# Altium schematic sheet ABPG_TOP.SchDoc
size A3; SheetNumber: 1; SheetTotal: 1; SchematicName: Top Schematic
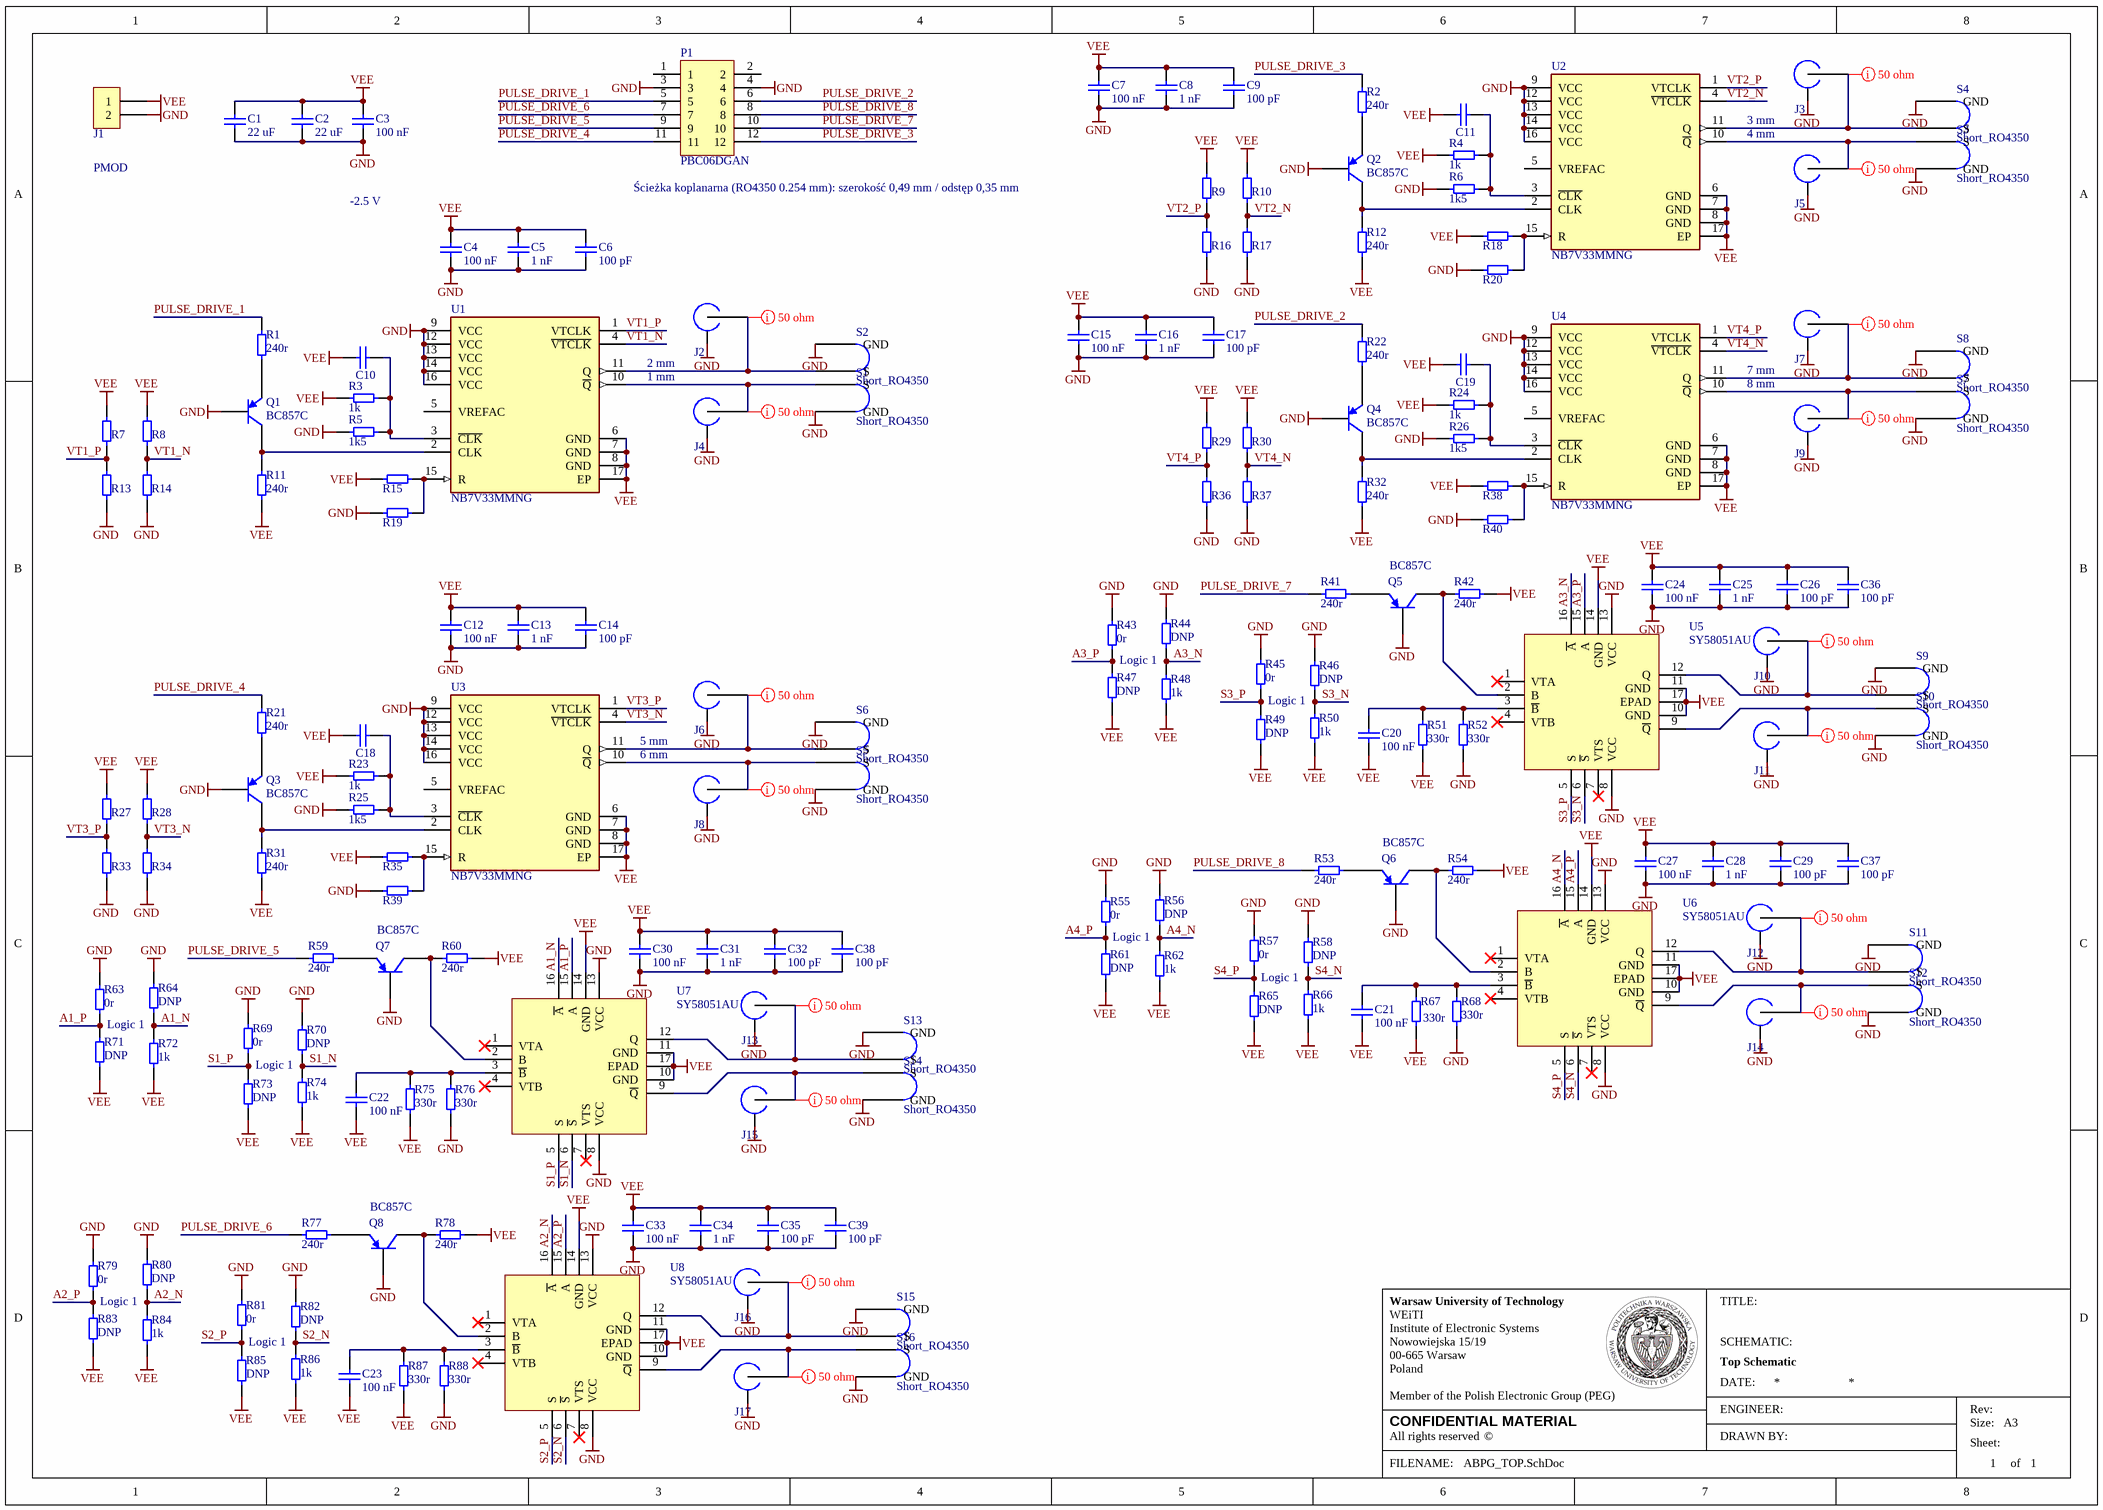
[diagram p0: ABPG_TOP.SchDoc]

## Parts
C1  22 uF  [C1210]
C2  22 uF  [C1210]
C3  100 nF  [C0402]
C4  100 nF  [C0402]
C5  1 nF  [C0402]
C6  100 pF  [C0402]
C7  100 nF  [C0402]
C8  1 nF  [C0402]
C9  100 pF  [C0402]
C10  100 nF  [0603-Capacitor]  (value not drawn)
C11  100 nF  [0603-Capacitor]  (value not drawn)
C12  100 nF  [C0402]
C13  1 nF  [C0402]
C14  100 pF  [C0402]
C15  100 nF  [C0402]
C16  1 nF  [C0402]
C17  100 pF  [C0402]
C18  100 nF  [0603-Capacitor]  (value not drawn)
C19  100 nF  [0603-Capacitor]  (value not drawn)
C20  100 nF  [0603-Capacitor]
C21  100 nF  [0603-Capacitor]
C22  100 nF  [0603-Capacitor]
C23  100 nF  [0603-Capacitor]
C24  100 nF  [C0402]
C25  1 nF  [C0402]
C26  100 pF  [C0402]
C27  100 nF  [C0402]
C28  1 nF  [C0402]
C29  100 pF  [C0402]
C30  100 nF  [C0402]
C31  1 nF  [C0402]
C32  100 pF  [C0402]
C33  100 nF  [C0402]
C34  1 nF  [C0402]
C35  100 pF  [C0402]
C36  100 pF  [C0402]
C37  100 pF  [C0402]
C38  100 pF  [C0402]
C39  100 pF  [C0402]
J1  1803426  [1803426]  (value not drawn)
J2  SF1621-60026  [SF1621-60026-RO4350-0.254]  (value not drawn)
J3  SF1621-60026  [SF1621-60026-RO4350-0.254]  (value not drawn)
J4  SF1621-60026  [SF1621-60026-RO4350-0.254]  (value not drawn)
J5  SF1621-60026  [SF1621-60026-RO4350-0.254]  (value not drawn)
J6  SF1621-60026  [SF1621-60026-RO4350-0.254]  (value not drawn)
J7  SF1621-60026  [SF1621-60026-RO4350-0.254]  (value not drawn)
J8  SF1621-60026  [SF1621-60026-RO4350-0.254]  (value not drawn)
J9  SF1621-60026  [SF1621-60026-RO4350-0.254]  (value not drawn)
J10  SF1621-60026  [SF1621-60026-RO4350-0.254]  (value not drawn)
J11  SF1621-60026  [SF1621-60026-RO4350-0.254]  (value not drawn)
J12  SF1621-60026  [SF1621-60026-RO4350-0.254]  (value not drawn)
J13  SF1621-60026  [SF1621-60026-RO4350-0.254]  (value not drawn)
J14  SF1621-60026  [SF1621-60026-RO4350-0.254]  (value not drawn)
J15  SF1621-60026  [SF1621-60026-RO4350-0.254]  (value not drawn)
J16  SF1621-60026  [SF1621-60026-RO4350-0.254]  (value not drawn)
J17  SF1621-60026  [SF1621-60026-RO4350-0.254]  (value not drawn)
P1  PBC06DGAN  [PBC06DGAN]
Q1  BC857C  [INF-SOT23_N]
Q2  BC857C  [INF-SOT23_N]
Q3  BC857C  [INF-SOT23_N]
Q4  BC857C  [INF-SOT23_N]
Q5  BC857C  [INF-SOT23_N]
Q6  BC857C  [INF-SOT23_N]
Q7  BC857C  [INF-SOT23_N]
Q8  BC857C  [INF-SOT23_N]
R1  240r  [0603-Resistor]
R2  240r  [0603-Resistor]
R3  1k  [0603-Resistor]
R4  1k  [0603-Resistor]
R5  1k5  [0603-Resistor]
R6  1k5  [0603-Resistor]
R7  DNP  [0603-Resistor]  (value not drawn)
R8  DNP  [0603-Resistor]  (value not drawn)
R9  DNP  [0603-Resistor]  (value not drawn)
R10  DNP  [0603-Resistor]  (value not drawn)
R11  240r  [0603-Resistor]
R12  240r  [0603-Resistor]
R13  DNP  [0603-Resistor]  (value not drawn)
R14  DNP  [0603-Resistor]  (value not drawn)
R15  *  [0603-Resistor]  (value not drawn)
R16  DNP  [0603-Resistor]  (value not drawn)
R17  DNP  [0603-Resistor]  (value not drawn)
R18  *  [0603-Resistor]  (value not drawn)
R19  *  [0603-Resistor]  (value not drawn)
R20  *  [0603-Resistor]  (value not drawn)
R21  240r  [0603-Resistor]
R22  240r  [0603-Resistor]
R23  1k  [0603-Resistor]
R24  1k  [0603-Resistor]
R25  1k5  [0603-Resistor]
R26  1k5  [0603-Resistor]
R27  DNP  [0603-Resistor]  (value not drawn)
R28  DNP  [0603-Resistor]  (value not drawn)
R29  DNP  [0603-Resistor]  (value not drawn)
R30  DNP  [0603-Resistor]  (value not drawn)
R31  240r  [0603-Resistor]
R32  240r  [0603-Resistor]
R33  DNP  [0603-Resistor]  (value not drawn)
R34  DNP  [0603-Resistor]  (value not drawn)
R35  *  [0603-Resistor]  (value not drawn)
R36  DNP  [0603-Resistor]  (value not drawn)
R37  DNP  [0603-Resistor]  (value not drawn)
R38  *  [0603-Resistor]  (value not drawn)
R39  *  [0603-Resistor]  (value not drawn)
R40  *  [0603-Resistor]  (value not drawn)
R41  240r  [0603-Resistor]
R42  240r  [0603-Resistor]
R43  0r  [0603-Resistor]
R44  DNP  [0603-Resistor]
R45  0r  [0603-Resistor]
R46  DNP  [0603-Resistor]
R47  DNP  [0603-Resistor]
R48  1k  [0603-Resistor]
R49  DNP  [0603-Resistor]
R50  1k  [0603-Resistor]
R51  330r  [0603-Resistor]
R52  330r  [0603-Resistor]
R53  240r  [0603-Resistor]
R54  240r  [0603-Resistor]
R55  0r  [0603-Resistor]
R56  DNP  [0603-Resistor]
R57  0r  [0603-Resistor]
R58  DNP  [0603-Resistor]
R59  240r  [0603-Resistor]
R60  240r  [0603-Resistor]
R61  DNP  [0603-Resistor]
R62  1k  [0603-Resistor]
R63  0r  [0603-Resistor]
R64  DNP  [0603-Resistor]
R65  DNP  [0603-Resistor]
R66  1k  [0603-Resistor]
R67  330r  [0603-Resistor]
R68  330r  [0603-Resistor]
R69  0r  [0603-Resistor]
R70  DNP  [0603-Resistor]
R71  DNP  [0603-Resistor]
R72  1k  [0603-Resistor]
R73  DNP  [0603-Resistor]
R74  1k  [0603-Resistor]
R75  330r  [0603-Resistor]
R76  330r  [0603-Resistor]
R77  240r  [0603-Resistor]
R78  240r  [0603-Resistor]
R79  0r  [0603-Resistor]
R80  DNP  [0603-Resistor]
R81  0r  [0603-Resistor]
R82  DNP  [0603-Resistor]
R83  DNP  [0603-Resistor]
R84  1k  [0603-Resistor]
R85  DNP  [0603-Resistor]
R86  1k  [0603-Resistor]
R87  330r  [0603-Resistor]
R88  330r  [0603-Resistor]
S1  Short_RO4350  [STD_SHORT]  (net tie, no BOM)
S2  Short_RO4350  [STD_SHORT]  (net tie, no BOM)
S3  Short_RO4350  [STD_SHORT]  (net tie, no BOM)
S4  Short_RO4350  [STD_SHORT]  (net tie, no BOM)
S5  Short_RO4350  [STD_SHORT]  (net tie, no BOM)
S6  Short_RO4350  [STD_SHORT]  (net tie, no BOM)
S7  Short_RO4350  [STD_SHORT]  (net tie, no BOM)
S8  Short_RO4350  [STD_SHORT]  (net tie, no BOM)
S9  Short_RO4350  [STD_SHORT]  (net tie, no BOM)
S10  Short_RO4350  [STD_SHORT]  (net tie, no BOM)
S11  Short_RO4350  [STD_SHORT]  (net tie, no BOM)
S12  Short_RO4350  [STD_SHORT]  (net tie, no BOM)
S13  Short_RO4350  [STD_SHORT]  (net tie, no BOM)
S14  Short_RO4350  [STD_SHORT]  (net tie, no BOM)
S15  Short_RO4350  [STD_SHORT]  (net tie, no BOM)
S16  Short_RO4350  [STD_SHORT]  (net tie, no BOM)
U1  NB7V33MMNG  [FP-485G-01-MFG]
U2  NB7V33MMNG  [FP-485G-01-MFG]
U3  NB7V33MMNG  [FP-485G-01-MFG]
U4  NB7V33MMNG  [FP-485G-01-MFG]
U5  SY58051AU  [QFN50P300X300X90_HS-17N]
U6  SY58051AU  [QFN50P300X300X90_HS-17N]
U7  SY58051AU  [QFN50P300X300X90_HS-17N]
U8  SY58051AU  [QFN50P300X300X90_HS-17N]

## Nets
GND: C1.2 C2.2 C3.2 C4.2 C5.2 C6.2 C7.2 C8.2 C9.2 C12.2 C13.2 C14.2 C15.2 C16.2 C17.2 C24.2 C25.2 C26.2 C27.2 C28.2 C29.2 C30.2 C31.2 C32.2 C33.2 C34.2 C35.2 C36.2 C37.2 C38.2 C39.2 J1.2 J2.0(GND) J3.0(GND) J4.0(GND) J5.0(GND) J6.0(GND) J7.0(GND) J8.0(GND) J9.0(GND) J10.0(GND) J11.0(GND) J12.0(GND) J13.0(GND) J14.0(GND) J15.0(GND) J16.0(GND) J17.0(GND) P1.3 P1.4 Q1.1(B) Q2.1(B) Q3.1(B) Q4.1(B) Q5.1(B) Q6.1(B) Q7.1(B) Q8.1(B) R5.2 R6.2 R13.2 R14.2 R16.2 R17.2 R19.2 R20.2 R25.2 R26.2 R33.2 R34.2 R36.2 R37.2 R39.2 R40.2 R43.2 R44.1 R45.1 R46.2 R52.2 R55.2 R56.1 R57.1 R58.2 R63.2 R64.1 R68.2 R69.1 R70.2 R76.2 R79.2 R80.1 R81.1 R82.2 R88.2 S1.0(GND) S2.0(GND) S3.0(GND) S4.0(GND) S5.0(GND) S6.0(GND) S7.0(GND) S8.0(GND) S9.0(GND) S10.0(GND) S11.0(GND) S12.0(GND) S13.0(GND) S14.0(GND) S15.0(GND) S16.0(GND) U1.9(VCC) U1.12(VCC) U1.13(VCC) U1.14(VCC) U1.16(VCC) U2.9(VCC) U2.12(VCC) U2.13(VCC) U2.14(VCC) U2.16(VCC) U3.9(VCC) U3.12(VCC) U3.13(VCC) U3.14(VCC) U3.16(VCC) U4.9(VCC) U4.12(VCC) U4.13(VCC) U4.14(VCC) U4.16(VCC) U5.8(VCC) U5.13(VCC) U6.8(VCC) U6.13(VCC) U7.8(VCC) U7.13(VCC) U8.8(VCC) U8.13(VCC)
VEE: C1.1 C2.1 C3.1 C4.1 C5.1 C6.1 C7.1 C8.1 C9.1 C10.1 C11.1 C12.1 C13.1 C14.1 C15.1 C16.1 C17.1 C18.1 C19.1 C20.2 C21.2 C22.2 C23.2 C24.1 C25.1 C26.1 C27.1 C28.1 C29.1 C30.1 C31.1 C32.1 C33.1 C34.1 C35.1 C36.1 C37.1 C38.1 C39.1 J1.1 R3.2 R4.2 R7.1 R8.1 R9.1 R10.1 R11.2 R12.2 R15.2 R18.2 R23.2 R24.2 R27.1 R28.1 R29.1 R30.1 R31.2 R32.2 R35.2 R38.2 R42.2 R47.2 R48.1 R49.1 R50.2 R51.2 R54.2 R60.2 R61.2 R62.1 R65.1 R66.2 R67.2 R71.2 R72.1 R73.1 R74.2 R75.2 R78.2 R83.2 R84.1 R85.1 R86.2 R87.2 U1.6(GND) U1.7(GND) U1.8(GND) U1.17(EP) U2.6(GND) U2.7(GND) U2.8(GND) U2.17(EP) U3.6(GND) U3.7(GND) U3.8(GND) U3.17(EP) U4.6(GND) U4.7(GND) U4.8(GND) U4.17(EP) U5.10(GND) U5.11(GND) U5.14(GND) U5.17(EPAD) U6.10(GND) U6.11(GND) U6.14(GND) U6.17(EPAD) U7.10(GND) U7.11(GND) U7.14(GND) U7.17(EPAD) U8.10(GND) U8.11(GND) U8.14(GND) U8.17(EPAD)
A1_N: R64.2 R72.2 U7.16(~{A})
A1_P: R63.1 R71.1 U7.15(A)
A2_N: R80.2 R84.2 U8.16(~{A})
A2_P: R79.1 R83.1 U8.15(A)
A3_N: R44.2 R48.2 U5.16(~{A})
A3_P: R43.1 R47.1 U5.15(A)
A4_N: R56.2 R62.2 U6.16(~{A})
A4_P: R55.1 R61.1 U6.15(A)
PULSE_DRIVE_1: P1.5 R1.2
PULSE_DRIVE_2: P1.6 R22.2
PULSE_DRIVE_3: P1.12 R2.2
PULSE_DRIVE_4: P1.11 R21.2
PULSE_DRIVE_5: P1.9 R59.2
PULSE_DRIVE_6: P1.7 R77.2
PULSE_DRIVE_7: P1.10 R41.2
PULSE_DRIVE_8: P1.8 R53.2
S1_N: R70.1 R74.1 U7.6(~{S})
S1_P: R69.2 R73.2 U7.5(S)
S2_N: R82.1 R86.1 U8.6(~{S})
S2_P: R81.2 R85.2 U8.5(S)
S3_N: R46.1 R50.1 U5.6(~{S})
S3_P: R45.2 R49.2 U5.5(S)
S4_N: R58.1 R66.1 U6.6(~{S})
S4_P: R57.2 R65.2 U6.5(S)
VT1_N: R8.2 R14.1 U1.4(~{VTCLK})
VT1_P: R7.2 R13.1 U1.1(VTCLK)
VT2_N: R10.2 R17.1 U2.4(~{VTCLK})
VT2_P: R9.2 R16.1 U2.1(VTCLK)
VT3_N: R28.2 R34.1 U3.4(~{VTCLK})
VT3_P: R27.2 R33.1 U3.1(VTCLK)
VT4_N: R30.2 R37.1 U4.4(~{VTCLK})
VT4_P: R29.2 R36.1 U4.1(VTCLK)
NetC10_2: C10.2 R3.1 R5.1 U1.3(~{CLK})
NetC11_2: C11.2 R4.1 R6.1 U2.3(~{CLK})
NetC18_2: C18.2 R23.1 R25.1 U3.3(~{CLK})
NetC19_2: C19.2 R24.1 R26.1 U4.3(~{CLK})
NetC20_1: C20.1 R51.1 R52.1 U5.3(~{B})
NetC21_1: C21.1 R67.1 R68.1 U6.3(~{B})
NetC22_1: C22.1 R75.1 R76.1 U7.3(~{B})
NetC23_1: C23.1 R87.1 R88.1 U8.3(~{B})
NetJ2_1: J2.1 S2.1(S) U1.11(Q)
NetJ3_1: J3.1 S4.1(S) U2.11(Q)
NetJ4_1: J4.1 S1.1(S) U1.10(~{Q})
NetJ5_1: J5.1 S3.1(S) U2.10(~{Q})
NetJ6_1: J6.1 S6.1(S) U3.11(Q)
NetJ7_1: J7.1 S8.1(S) U4.11(Q)
NetJ8_1: J8.1 S5.1(S) U3.10(~{Q})
NetJ9_1: J9.1 S7.1(S) U4.10(~{Q})
NetJ10_1: J10.1 S9.1(S) U5.12(Q)
NetJ11_1: J11.1 S10.1(S) U5.9(~{Q})
NetJ12_1: J12.1 S11.1(S) U6.12(Q)
NetJ13_1: J13.1 S13.1(S) U7.12(Q)
NetJ14_1: J14.1 S12.1(S) U6.9(~{Q})
NetJ15_1: J15.1 S14.1(S) U7.9(~{Q})
NetJ16_1: J16.1 S15.1(S) U8.12(Q)
NetJ17_1: J17.1 S16.1(S) U8.9(~{Q})
NetQ1_2: Q1.2(E) R1.1
NetQ1_3: Q1.3(C) R11.1 U1.2(CLK)
NetQ2_2: Q2.2(E) R2.1
NetQ2_3: Q2.3(C) R12.1 U2.2(CLK)
NetQ3_2: Q3.2(E) R21.1
NetQ3_3: Q3.3(C) R31.1 U3.2(CLK)
NetQ4_2: Q4.2(E) R22.1
NetQ4_3: Q4.3(C) R32.1 U4.2(CLK)
NetQ5_2: Q5.2(E) R41.1
NetQ5_3: Q5.3(C) R42.1 U5.2(B)
NetQ6_2: Q6.2(E) R53.1
NetQ6_3: Q6.3(C) R54.1 U6.2(B)
NetQ7_2: Q7.2(E) R59.1
NetQ7_3: Q7.3(C) R60.1 U7.2(B)
NetQ8_2: Q8.2(E) R77.1
NetQ8_3: Q8.3(C) R78.1 U8.2(B)
NetR15_1: R15.1 R19.1 U1.15(R)
NetR18_1: R18.1 R20.1 U2.15(R)
NetR35_1: R35.1 R39.1 U3.15(R)
NetR38_1: R38.1 R40.1 U4.15(R)

Not connected (* = marked no-connect by the designer): P1 1 2; U1 5(VREFAC); U2 5(VREFAC); U3 5(VREFAC); U4 5(VREFAC); U5 1(VTA)* 4(VTB)* 7(VTS)*; U6 1(VTA)* 4(VTB)* 7(VTS)*; U7 1(VTA)* 4(VTB)* 7(VTS)*; U8 1(VTA)* 4(VTB)* 7(VTS)*

## Layout directives
net class 50 ohm: NetJ2_1, NetJ3_1, NetJ4_1, NetJ5_1, NetJ6_1, NetJ7_1, NetJ8_1, NetJ9_1, NetJ10_1, NetJ11_1, NetJ12_1, NetJ13_1, NetJ14_1, NetJ15_1, NetJ16_1, NetJ17_1

## Notes on the sheet
- (near J1) PMOD
- 3 mm
- 4 mm
- -2.5 V
- (near P1) Ścieżka koplanarna (RO4350 0.254 mm): szerokość 0,49 mm / odstęp 0,35 mm
- 2 mm
- 1 mm
- 7 mm
- 8 mm
- Logic 1
- 5 mm
- 6 mm
- WEiTI
- Warsaw University of Technology
- TITLE:
- 00-665 Warsaw
- Nowowiejska 15/19
- Institute of Electronic Systems
- Poland
- Member of the Polish Electronic Group (PEG)
- DATE:
- SCHEMATIC:
- All rights reserved
- CONFIDENTIAL MATERIAL
- ©
- ENGINEER:
- DRAWN BY:
- Size:
- Rev:
- Sheet:
- A3
- FILENAME:
- of

## Library data of the parts
C1-C9 C12-C17 C24-C39 = Capacitor: Manufacturer: *; ManufacturerNr: *; Voltage Rating: *; Dielectric: *; Tolerance: *
  C1 C2: Value: 22 uF; Package: 1210
  C3 C4 C7 C12 C15 C24 C27 C30 C33: Value: 100 nF; Package: 0402
  C5 C8 C13 C16 C25 C28 C31 C34: Value: 1 nF; Package: 0402
  C6 C9 C14 C17 C26 C29 C32 C35-C39: Value: 100 pF; Package: 0402
C10 C11 C18-C23 = C0603: Capacitor; Part Number: C0603; Pin Count: 2; Manufacturer: *; Package: 0603; ManufacturerNr: *; Value: 100 nF; Voltage Rating: *; Dielectric: *
J1 = 1803426: 2 Position Terminal Block Header; Manufacturer: Phoenix Contact; Designator: J?; Part Number: 1803426; Component Kind: Standard; Component Type: Standard; Pin Count: 2; ManufacturerNr: 1803426; Footprint Type: Through hole
J2-J17 = SF1621-60026: CONN 2.4MM JACK STR 50OHM SCREW; Manufacturer: Amphenol; Part Number: SF1621-60026; Component Kind: Standard; Component Type: Standard; Designator: SF1621-60026; Footprint: SF1621-60026; Pin Count: 2; ManufacturerNr: SF1621-60026; Package: SF1621-60026; Footprint Type: SMD
P1 = PBC06DGAN: Double-row jumper plug (female) 5x2; Manufacturer: Sullins Connector Solutions; Designator: PPPC052LFBN-RC; Part Number: PBC06DGAN; Component Kind: Standard; Component Type: Standard; Pin Count: 12; ManufacturerNr: PBC06DGAN; Package: PBC06DGAN; Footprint Type: THD
Q1-Q8 = CMP-1177-00039-1: PNP Silicon AF Transistor, 45 V VCEO, 100 mA IC, SOT23, Reel, Green; Manufacturer: Infineon; VCBO (max): 50Â V; fT (typ): 250Â MHz; ICBO (max): 15Â nA; IC (max): 100Â mA; Green: TRUE; IBM (max): 200Â mA; VEBO (max): 5Â V; VCEO (max): 45Â V; Ptot (max): 330Â mW; PackageDescription: 3-Pin Small Outline Transistor Package, 1.3 x 2.9 mm Body, 0.95 mm Pitch; ComponentLink2Description: Datasheet; PackageReference: SOT23; ComponentLink3Description: Package Specification; ComponentLink1URL: http://www.infineon.com/; ComponentLink1Description: Manufacturer URL; Mounting Technology: Surface Mount; PackageVersion: Apr-08; ComponentLink3URL: http://www.infineon.com/dgdl/SOT23-Package_Overview.pdf?folderId=db3a30431936bc4b0119532290053c66&fileId=db3a30431936bc4b0119533468123c85; ComponentLink2URL: http://www.infineon.com/dgdl/bc857series_bc858series_bc859series_bc860series.pdf?folderId=db3a304314dca389011541d30fa21656&fileId=db3a304314dca389011541da0e3a1661; Polarity: PNP; ICM (max): 200Â mA; PartNumber: BC857C; Packing: Reel
R1-R88 = R0603: Resistor; Part Number: R0603; Pin Count: 2; Manufacturer: *; Package: 0603; ManufacturerNr: *
  R1 R2 R11 R12 R21 R22 R31 R32 R41 R42 R53 R54 R59 R60 R77 R78: Value: 240r
  R3 R4 R23 R24 R48 R50 R62 R66 R72 R74 R84 R86: Value: 1k
  R5 R6 R25 R26: Value: 1k5
  R7-R10 R13 R14 R16 R17 R27-R30 R33 R34 R36 R37 R44 R46 R47 R49 R56 R58 R61 R64 R65 R70 R71 R73 R80 R82 R83 R85: Value: DNP
  R15 R18-R20 R35 R38-R40: Value: *
  R43 R45 R55 R57 R63 R69 R79 R81: Value: 0r
  R51 R52 R67 R68 R75 R76 R87 R88: Value: 330r
U1-U4 = CMP-07066-000001-1: IC CLK DIVIDER 1:1 10GHZ 16QFN; Manufacturer: ON Semiconductor; Number Of Elements: 1; Propagation Delay: 0.26ns; Max Supply Voltage: 2.625V; Min Supply Voltage: 1.71V; Nominal Supply Current: 85-95mA; Standoff Height: 0mm; Mouser Description: Clock Drivers & Distribution 1.8V / 2.5V 10GHz; Lead Free: Yes; Ambient Temperature Range Low: -40°C; Digikey Description: IC CLK DIVIDER 1:1 10GHZ 16QFN; Temperature Range Low: -40°C; RoHS: TRUE; Device Class L1: Integrated Circuits (ICs); Device Class L2: Clock and Timing; Footprint Url: https://www.onsemi.com/pub/Collateral/485G-01.PDF; Height: 1mm; Device Class L3: Drivers; Manufacturer Part Number: NB7V33MMNG; ComponentLink2URL: https://www.onsemi.com/pub/Collateral/NB7V33M-D.PDF; Ambient Temperature Range High: +85°C; Ipc Land Pattern Name: QFN50P300X300X90-16; Package: 485G-01; Octopart: https://octopart.com/nb7v33mmng-on+semiconductor-15753900; Number Of Inputs: 1; Automotive: No; Category: IC; Number Of Outputs: 1; Temperature: -40°C to +85°C; Temperature Range High: +85°C; ComponentLink2Description: Datasheet
U5-U8 = SY58051AU: Ultra-Precision CML AnyGate® with Internal Input and Output Termination; Manufacturer: Microchip / Micrel; Manufacturer Part Number: SY58051AU